# Altium schematic sheet AFC_AVR.SchDoc: AFC — Automatic Fan Controller
size A4; Author: Hussam Ali; Revision: 2.1; SheetNumber: 1; SheetTotal: 1; PageTitle: AFC_AVR
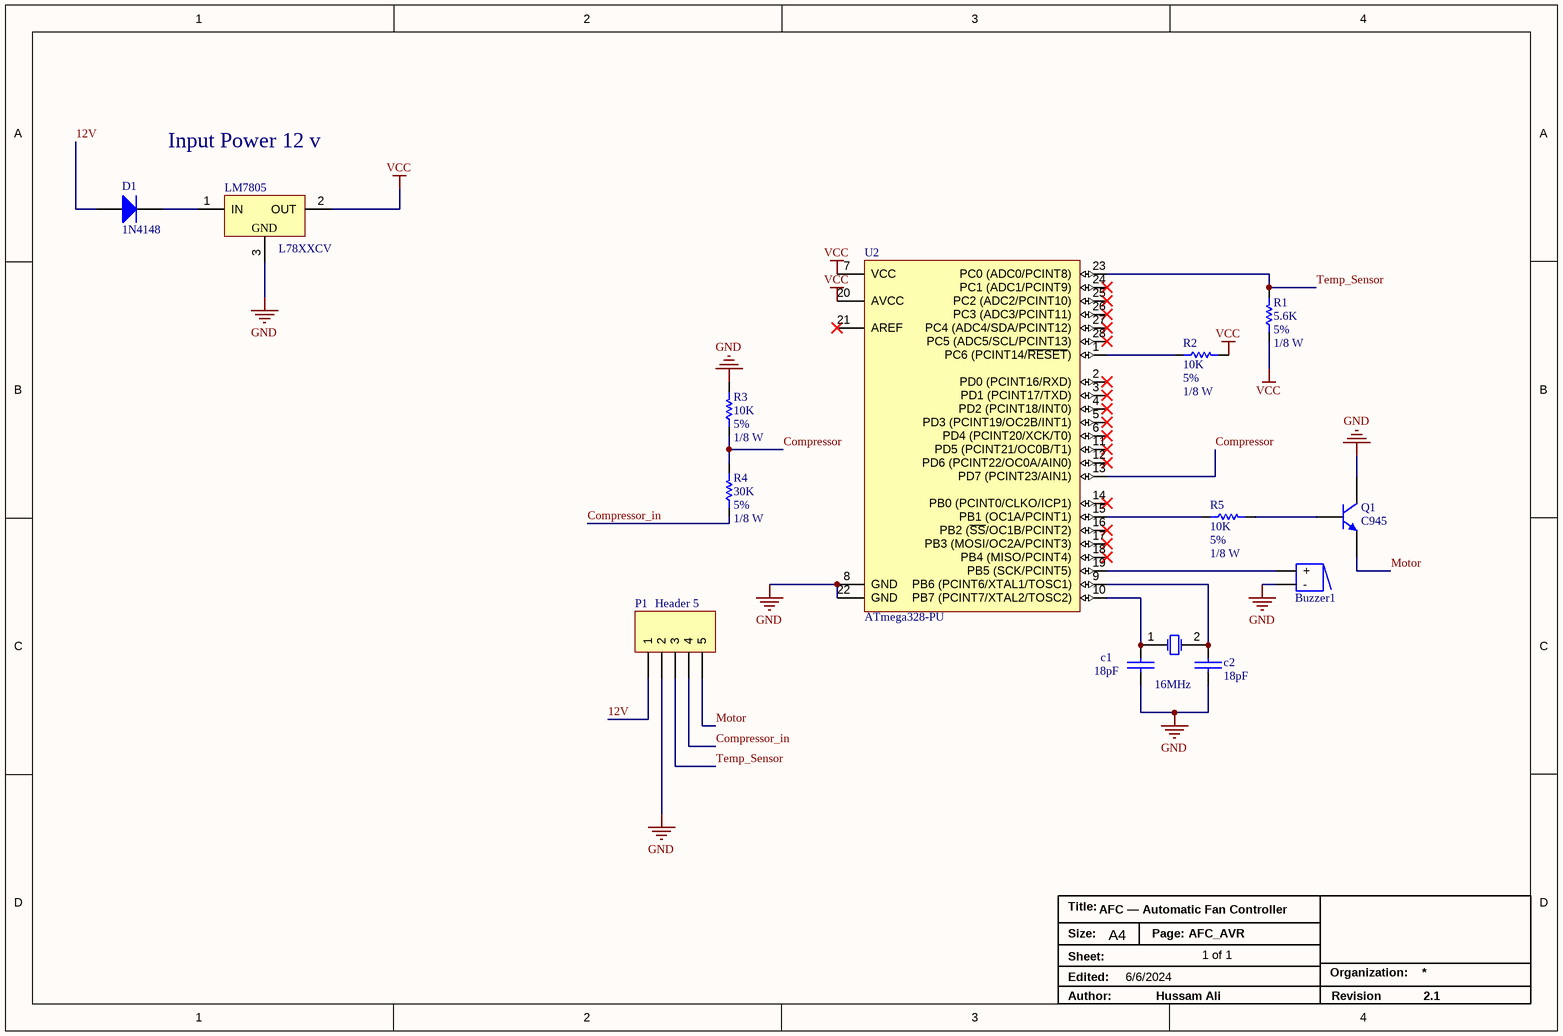
[diagram p0: AFC_AVR.SchDoc]

## Parts
16MHz  11.0592 MHz  [XTAL Small]  (value not drawn)
Buzzer1  Buzzer  [BUZZER]  (value not drawn)
c1  18pF  [Cap - 100nF]
c2  18pF  [Cap - 100nF]
D1  1N4148  [Diode-1n4001]
LM7805  L78XXCV  [78XXCV - Right]
P1  Header 5  [HDR1X5]
Q1  C945  [C945]
R1  Tolerance: 5%  Power: 1/8 W  [Res-(1/4)]  (hidden comment: 5.6K)
R2  Tolerance: 5%  Power: 1/8 W  [Res-(1/4)]  (hidden comment: 10K)
R3  Tolerance: 5%  Power: 1/8 W  [Res-(1/4)]  (hidden comment: 10K)
R4  Tolerance: 5%  Power: 1/8 W  [Res-(1/4)]  (hidden comment: 30K)
R5  Tolerance: 5%  Power: 1/8 W  [Res-(1/4)]  (hidden comment: 10K)
U2  ATmega328-PU  [28P3]

## Nets
GND: Buzzer1.2(-) c1.2(-) c2.2(-) LM7805.3(GND) P1.2 Q1.2(C) R3.2 U2.8(GND) U2.22(GND)
VCC: LM7805.2(OUT) R1.1 R2.2 U2.7(VCC) U2.20(AVCC)
12V: D1.1(A) P1.1
Compressor: R3.1 R4.2 U2.13(PD7_(PCINT23/AIN1))
Compressor_in: P1.4 R4.1
Motor: P1.5 Q1.1(E)
Temp_Sensor: P1.3 R1.2 U2.23(PC0_(ADC0/PCINT8))
Net16MHz_1: 16MHz.1(OSC1) c1.1(+) U2.10(PB7_(PCINT7/XTAL2/TOSC2))
Net16MHz_2: 16MHz.2(OSC2) c2.1(+) U2.9(PB6_(PCINT6/XTAL1/TOSC1))
NetBuzzer1_1: Buzzer1.1(+) U2.19(PB5_(SCK/PCINT5))
NetD1_2: D1.2(K) LM7805.1(IN)
NetQ1_3: Q1.3(B) R5.2
NetR2_1: R2.1 U2.1(PC6_(PCINT14/~{RESET}))
NetR5_1: R5.1 U2.15(PB1_(OC1A/PCINT1))

Not connected (* = marked no-connect by the designer): U2 2(PD0_(PCINT16/RXD))* 3(PD1_(PCINT17/TXD))* 4(PD2_(PCINT18/INT0))* 5(PD3_(PCINT19/OC2B/INT1))* 6(PD4_(PCINT20/XCK/T0))* 11(PD5_(PCINT21/OC0B/T1))* 12(PD6_(PCINT22/OC0A/AIN0))* 14(PB0_(PCINT0/CLKO/ICP1))* 16(PB2_(~{SS}/OC1B/PCINT2))* 17(PB3_(MOSI/OC2A/PCINT3))* 18(PB4_(MISO/PCINT4))* 21(AREF)* 24(PC1_(ADC1/PCINT9))* 25(PC2_(ADC2/PCINT10))* 26(PC3_(ADC3/PCINT11))* 27(PC4_(ADC4/SDA/PCINT12))* 28(PC5_(ADC5/SCL/PCINT13))*

## Notes on the sheet
- Input Power 12 v
- Title:
- Size:
- Sheet:
- Author:
- Edited:
- A4
- Page:
- 6/6/2024
- Organization:
- Revision

## Library data of the parts
16MHz = XTAL: XTAL Crystal; Company: E.P.I.L; Design Date: 11/04/2011; Value: 11.0592 MHz
Buzzer1 = Buzzer: Designer: Seyed Mohsen Ghasemain; ComponentLinkURL: www.picpars.com
c1 c2 = Cap-Bipolar: Bipolar Capacitor; Voltage: 100V; Designer: Saeid Jorablo; Organazation: ControTec; Adding Date: 1387/12/20; Value: 18pF
D1 = Diode 1N4148: High Conductance Fast Diode; Published: 8-Jun-2000; LatestRevisionDate: 17-Jul-2002; LatestRevisionNote: Re-released for DXP Platform.; DatasheetVersion: 1997; PackageReference: DO-35; Publisher: Altium Limited; PackageDescription: Diode, Axial; Body 3.8 x 1.9 mm (LxDia. max), Lead Dia. 0.53 mm (max); Code_JEDEC: DO-204-AH; ComponentLink1Description: Manufacturer Link; ComponentLink1URL: http://www.fairchildsemi.com/; ComponentLink2Description: Datasheet; ComponentLink2URL: http://www.fairchildsemi.com/ds/1N%2F1N4148.pdf
LM7805 = L78XXCV: Fixed Voltage Regulator; Designer: Saeid Jorablo; Company: ControTec; Adding Date: 1387/01/06; Voltage: *
P1 = Header 5: Header, 4-Pin; LatestRevisionDate: 17-Jul-2002; LatestRevisionNote: Re-released for DXP Platform.; Publisher: Altium Limited
Q1 = C945: NPN Transistor; Designer: Saeid Jorablo; Company: IPA CO; Last Update Time: 2008/08/04; Value: C945
R1-R5 = Resistor
  R1: Value: 5.6K
  R2 R3 R5: Value: 10K
  R4: Value: 30K
U2 = CMP-0095-00015-2: 8-bit AVR Microcontroller, 32KB Flash, 1KB EEPROM, 2KB SRAM, 28-pin PDIP, Industrial Grade (-40°C to 85°C); ComponentLink3Description: ATmega48A/48PA/88A/88PA/168A/168PA/328/328P Summary; RevisionNote: DatasheetVersion updated. URLs added.; DatasheetVersion: revD, May-2011; ComponentLink1URL: http://www.atmel.com/; PackageVersion: revB, Sep-2001; PackageDescription: 28-lead (0.300"/7.62mm Wide) Plastic Dual Inline Package (PDIP); PackageReference: 28P3; ComponentLink1Description: Manufacturer URL; ComponentLink2Description: ATmega48A/48PA/88A/88PA/168A/168PA/328/328P Datasheet; ComponentLink3URL: http://www.atmel.com/dyn/resources/prod_documents/8271S.pdf; ComponentLink2URL: http://www.atmel.com/dyn/resources/prod_documents/8271.pdf